# Altium schematic sheet IMU.SchDoc: IMU
size Tabloid; Author: Adam Turaj; SheetNumber: 5; SheetTotal: 6
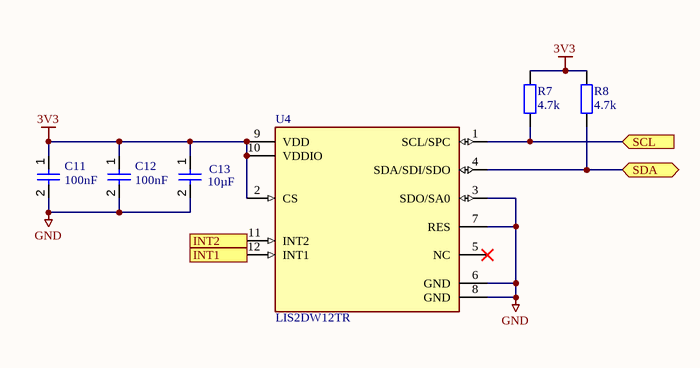
[diagram p0: IMU.SchDoc]

## Parts
C11  100nF  [CAPC1608X90X40NL10T20]
C12  100nF  [CAPC1608X90X40NL10T20]
C13  10µF  [CAPC0603(1608)100_L]
R7  4.7k  [RESC1608X55X25ML10T15]
R8  4.7k  [RESC1608X55X25ML10T15]
U4  LIS2DW12TR  [FP-LGA12-DM00170568-MFG]

## Ports
INT1 (out, see Root[4B]), INT2 (out, see Root[4B]), SCL (in, see Root[4B], Battery_Charger[3C], Display[4B], MCU[5B]), SDA (bidir, see Root[4B], Battery_Charger[3C], Display[4B], MCU[5B])

## Nets
3V3: C11.1 C12.1 C13.1 R7.2 R8.2 U4.2(CS) U4.9(VDD) U4.10(VDDIO)
GND: C11.2 C12.2 C13.2 U4.3(SDO/SA0) U4.6(GND) U4.7(RES) U4.8(GND)
INT1: U4.12(INT1) ; port INT1
INT2: U4.11(INT2) ; port INT2
SCL: R7.1 U4.1(SCL/SPC) ; port SCL
SDA: R8.1 U4.4(SDA/SDI/SDO) ; port SDA

Not connected (* = marked no-connect by the designer): U4 5(NC)*

## Notes on the sheet
- Title:
- Author:
- Size:
- Date:
- Git Hash:
- Tabloid
- Prj:
- Variant:
- Edited:
- File:

## Library data of the parts
C11 C12 = CMP-001-00017-6: Chip Capacitor, 100 nF, +/- 10%, 50 V, 0603 (1608 Metric); Voltage Rating: 50V; Capacitor Type: Ceramic; Tolerance: 10%; Mounting Technology: SM; Value: 100nF; Max Operating Temperature: 125°C; RoHS Compliant: True; Pins: 2; Case/Package: 0603; Min Operating Temperature: -55°C
C13 = CMP-001-00075-4: Chip Capacitor, 10µF +/-20%, 10V, 0603, Thickness 1 mm; Tolerance: 10%; Voltage Rating: 10V; Max Operating Temperature: 85°C; Pins: 2; Case/Package: 0603; Mounting Technology: SMT; Min Operating Temperature: -55°C; Value: 10µF
R7 R8 = CMP-009-00031-5: Chip Resistor, 4.7 KOhm, +/- 1%, 0.1 W, -55 to 155 degC, 0603 (1608 Metric); Power: 100mW; Tolerance: 1%; Mounting Technology: SM; Case/Package: 0603; Value: 4.7k; RoHS Compliant: True; Pins: 2; Min Operating Temperature: -55°C; Max Operating Temperature: 155°C
U4 = CMP-12175-000006-1: ACCEL 2-16G I2C/SPI 12LGA; Manufacturer: STMicroelectronics; Min Supply Voltage: 1.62V; Operating Supply Current: 0.38-90uA; Sensor Output: I2C,SPI; Accel Resolution: 14bits; Max Supply Voltage: 3.6V; Accel Range: 2/4/8/16g; Height: 0.7mm; Device Class L1: Sensors; RoHS: TRUE; Temperature Range Low: -40°C; Category: IC; Mouser Description: Accelerometer Triple ±2g/±4g/±8g/±16g 1.62V to 3.6V 0.244mg/digit/0.488mg/digit/0.976mg/digit/1.952mg/digit 12-Pin LG...; Digikey Description: ACCEL 2-16G I2C/SPI 12LGA; ComponentLink2URL: https://www.st.com/resource/en/datasheet/lis2dw12.pdf; Automotive: No; Manufacturer Part Number: LIS2DW12TR; Lead Free: Yes; Footprint Url: https://www.st.com/content/ccc/resource/technical/document/technical_note/73/17/9c/16/dd/96/4a/01/CD00134799.pdf/files/CD00134799.pdf/jcr:content/translations/en.CD00134799.pdf; Temperature: -40°C to +85°C; Device Class L3: Accelerometers; Package: LGA12-DM00170568; Temperature Range High: +85°C; Device Class L2: Motion Sensors; Octopart: https://octopart.com/lis2dw12tr-stmicroelectronics-77080925; ComponentLink2Description: Datasheet